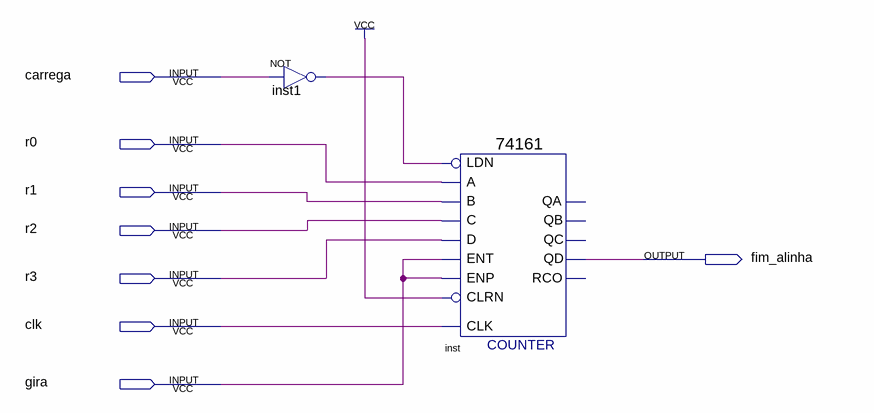
[diagram p0: schematic sheet]
// Quartus schematic alinha.bdf as structural Verilog: 2 symbols, 8 pins
module alinha (
  input  carrega,
  input  r0,
  input  r1,
  input  r2,
  input  r3,
  input  clk,
  input  gira,
  output fim_alinha
);

  wire inst1_out;

  not inst1 (inst1_out, carrega);
  \74161  inst (
    .CLRN(1'b1), .CLK(clk), .ENP(gira), .LDN(inst1_out), .A(r0), .D(r3), .ENT(gira), .B(r1), .C(r2),
    .QD(fim_alinha));  // open: QC, QB, QA, RCO
endmodule
